# Altium schematic sheet MCU.SchDoc
size A; SheetNumber: 6; SheetTotal: 6
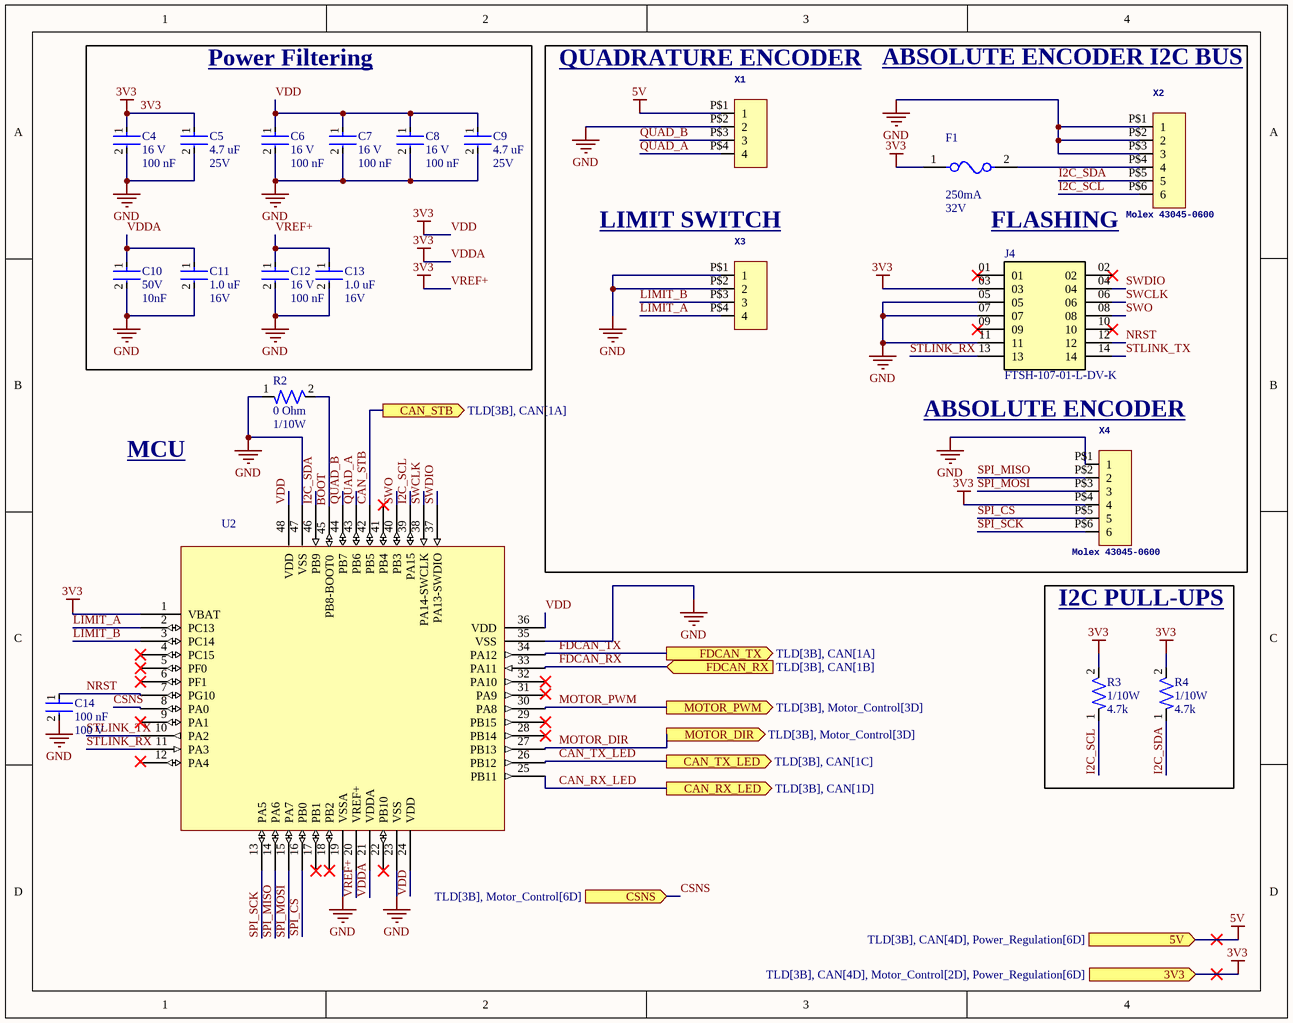
[diagram p0: MCU.SchDoc]

## Parts
C4  Voltage Rating: 16 V  Capacitance: 100 nF  [CAP-0402]  (hidden comment: CC0402KRX7R7BB104)
C5  Capacitance: 4.7 uF  Voltage: 25V  [CAP-0603]  (hidden comment: CC0603KRX5R8BB475)
C6  Voltage Rating: 16 V  Capacitance: 100 nF  [CAP-0402]  (hidden comment: CC0402KRX7R7BB104)
C7  Voltage Rating: 16 V  Capacitance: 100 nF  [CAP-0402]  (hidden comment: CC0402KRX7R7BB104)
C8  Voltage Rating: 16 V  Capacitance: 100 nF  [CAP-0402]  (hidden comment: CC0402KRX7R7BB104)
C9  Capacitance: 4.7 uF  Voltage: 25V  [CAP-0603]  (hidden comment: CC0603KRX5R8BB475)
C10  Voltage: 50V  Capacitance: 10nF  [CAP-0805]  (hidden comment: GRM2195C1H103JA01D)
C11  Capacitance: 1.0 uF  Voltage: 16V  [CAP-0603]  (hidden comment: CC0603KRX7R7BB105)
C12  Voltage Rating: 16 V  Capacitance: 100 nF  [CAP-0402]  (hidden comment: CC0402KRX7R7BB104)
C13  Capacitance: 1.0 uF  Voltage: 16V  [CAP-0603]  (hidden comment: CC0603KRX7R7BB105)
C14  Capacitance: 100 nF  Voltage: 100 V  [CAP-0603]  (hidden comment: CC0603KRX7R0BB104)
F1  Fuse Current: 250mA  Voltage Rating: 32V  [RES-0603]  (hidden comment: 0467.250NRHF)
J4  FTSH-107-01-L-DV-K  [SAMTEC_FTSH-107-01-L-DV-K]
R2  Resistance: 0 Ohm  Power: 1/10W  [RESC1607X60N]  (hidden comment: RESC1607X60N)
R3  Power: 1/10W  Resistance: 4.7k  [RES-0603]  (hidden comment: RC0603FR-074K7L)
R4  Power: 1/10W  Resistance: 4.7k  [RES-0603]  (hidden comment: RC0603FR-074K7L)
U2  STM32G431CBT6  [IC-LQFP48]  (value not drawn)
X1  Molex - Micro-Fit 3.0 Series connector,  3.00mm (0.118") pitch header, 4 positions.  [43045-0400]  (value not drawn)
X2  Molex 43045-0600  [43045-0600]
X3  Molex - Micro-Fit 3.0 Series connector,  3.00mm (0.118") pitch header, 4 positions.  [43045-0400]  (value not drawn)
X4  Molex 43045-0600  [43045-0600]

## Blocks framed on the sheet
Power Filtering: C4-C13
I2C PULL-UPS: R3 R4

## Ports
3V3 (in, see TLD[3B], CAN[4D], Motor_Control[2D], Power_Regulation[6D]), 5V (in, see TLD[3B], CAN[4D], Power_Regulation[6D]), CAN_RX_LED (out, see TLD[3B], CAN[1D]), CAN_STB (out, see TLD[3B], CAN[1A]), CAN_TX_LED (out, see TLD[3B], CAN[1C]), CSNS (in, see TLD[3B], Motor_Control[6D]), FDCAN_RX (in, see TLD[3B], CAN[1B]), FDCAN_TX (out, see TLD[3B], CAN[1A]), MOTOR_DIR (out, see TLD[3B], Motor_Control[3D]), MOTOR_PWM (out, see TLD[3B], Motor_Control[3D])

## Nets
3V3: C4.1 C5.1 C6.1 C7.1 C8.1 C9.1 C10.1 C11.1 C12.1 C13.1 F1.1 J4.03 R3.2 R4.2 U2.1(VBAT) U2.20(VREF+) U2.21(VDDA) U2.24(VDD) U2.36(VDD) U2.48(VDD) X4.P$4(4) ; port 3V3  [also labelled VDD, VDDA, VREF+]
5V: X1.P$1(1) ; port 5V
GND: C4.2 C5.2 C6.2 C7.2 C8.2 C9.2 C10.2 C11.2 C12.2 C13.2 C14.2 J4.05 J4.07 J4.11 R2.1 U2.19(VSSA) U2.23(VSS) U2.35(VSS) U2.47(VSS) X1.P$2(2) X2.P$1(1) X2.P$2(2) X2.P$3(3) X3.P$1(1) X3.P$2(2) X4.P$1(1)
BOOT: R2.2 U2.45(PB8-BOOT0)
CAN_RX_LED: U2.25(PB11) ; port CAN_RX_LED
CAN_STB: U2.42(PB5) ; port CAN_STB
CAN_TX_LED: U2.26(PB12) ; port CAN_TX_LED
CSNS: U2.8(PA0) ; port CSNS
FDCAN_RX: U2.33(PA11) ; port FDCAN_RX
FDCAN_TX: U2.34(PA12) ; port FDCAN_TX
I2C_SCL: R3.1 U2.39(PA15) X2.P$6(6)
I2C_SDA: R4.1 U2.46(PB9) X2.P$5(5)
LIMIT_A: U2.2(PC13) X3.P$4(4)
LIMIT_B: U2.3(PC14) X3.P$3(3)
MOTOR_DIR: U2.27(PB13) ; port MOTOR_DIR
MOTOR_PWM: U2.30(PA8) ; port MOTOR_PWM
NRST: C14.1 J4.12 U2.7(PG10)
QUAD_A: U2.43(PB6) X1.P$4(4)
QUAD_B: U2.44(PB7) X1.P$3(3)
SPI_CS: U2.16(PB0) X4.P$5(5)
SPI_MISO: U2.14(PA6) X4.P$2(2)
SPI_MOSI: U2.15(PA7) X4.P$3(3)
SPI_SCK: U2.13(PA5) X4.P$6(6)
STLINK_RX: J4.13 U2.11(PA3)
STLINK_TX: J4.14 U2.10(PA2)
SWCLK: J4.06 U2.38(PA14-SWCLK)
SWDIO: J4.04 U2.37(PA13-SWDIO)
SWO: J4.08 U2.40(PB3)
NetF1_2: F1.2 X2.P$4(4)

Not connected (* = marked no-connect by the designer): J4 01* 02* 09* 10*; U2 4(PC15)* 5(PF0)* 6(PF1)* 9(PA1)* 12(PA4) 17(PB1)* 18(PB2)* 22(PB10)* 28(PB14)* 29(PB15)* 31(PA9) 32(PA10)* 41(PB4)*

## Notes on the sheet
- (near X1) QUADRATURE ENCODER
- ABSOLUTE ENCODER I2C BUS
- LIMIT SWITCH
- FLASHING
- ABSOLUTE ENCODER
- MCU

## Library data of the parts
C4 C6-C8 C12 = CAP-0.1U-0001: CAP CER 0.1UF 16V X7R 0402; ComponentLink2Description: Datasheet; ComponentLink2URL: https://www.yageo.com/upload/media/product/productsearch/datasheet/mlcc/UPY-GPHC_X7R_6.3V-to-250V_24.pdf; Device Class: Ceramic; Size: 0402
C5 C9 = CAP-4.7U-0001: CAP CER 4.7UF 25V X5R 0603; Device Class: Ceramic; Size: 0603
C10 = CAP-10N-0001: CAP CER 10000PF 50V C0G/NP0 0805; Device Class: Ceramic; Size: 0805; ComponentLink1Description: Datasheet; ComponentLink1URL: https://search.murata.co.jp/Ceramy/image/img/A01X/G101/ENG/GRM2195C1H103JA01-01.pdf
C11 C13 = CAP-1U-0002: CAP CER 1UF 16V X7R 0603; Device Class: Ceramic; Size: 0603
C14 = CAP-100N-0001: CAP CER 0.1UF 100V X7R 0603; Device Class: Ceramic; Size: 0603; ComponentLink1Description: Datasheet; ComponentLink1URL: https://www.yageo.com/upload/media/product/app/datasheet/mlcc/upy-np0x7r_mv_100-to-630v.pdf
F1 = FUSE-0002: FUSE BRD MT 250MA 32VAC 32VDC; ComponentLink2Description: Datasheet; ComponentLink2URL: https://www.littelfuse.com/media?resourcetype=datasheets&itemid=4a59f034-1cca-460e-a5ba-e1e66247c76d&filename=littelfuse_fuse_467_datasheet.pdf
J4 = CONN_Flashing-0001: Connector Header Surface Mount 14 position 0.050" (1.27mm); MF: Samtec; Value: *; Price: None; Package: None; Availability: Unavailable; MP: FTSH-107-01-L-DV-K; ComponentLink1Description: Datasheet; ComponentLink1URL: https://mm.digikey.com/Volume0/opasdata/d220001/medias/docus/6209/ftsh-1xx-xx-xxx-dv-xxx-xxx-x-xx-mkt.pdf
R2 = RES-0-0003: 0 Ohms Jumper Chip Resistor 0603 (1608 Metric) Moisture Resistant Thick Film; assembled?: yes; JLC part number: C106231
R3 R4 = RES-4.7k-0001: RES 4.7K OHM 1% 1/10W 0603; Tolerance: 1%; Size: 0603; ComponentLink1Description: Datasheet; ComponentLink1URL: https://www.yageo.com/upload/media/product/products/datasheet/rchip/PYu-RC_Group_51_RoHS_L_12.pdf
U2 = IC-STM32G431CBT6: IC MCU 32BIT 128KB FLASH 48LQFP; Package: 48LQFP; ComponentLink1Description: Datasheet; ComponentLink1URL: https://www.st.com/resource/en/datasheet/stm32g431cb.pdf
X1 X3 = HEADER_POS4_?43045-0401: GateName_1: G$1; SymbolName_1: HEADER_POS4; DeviceName: 43045-0401; LibraryName: con-molex-micro-fit-3_0_2; DeviceSetName: HEADER_POS4_?; Package: 43045-0400
X2 X4 = Micro-Fit Molex 6 Pin 2 Row Right Angle: GateName_1: G$1; SymbolName_1: HEADER_POS6; DeviceSetName: HEADER_POS6_?; DeviceName: 43045-0600; LibraryName: con-molex-micro-fit-3_0_2; Package: 43045-0600